# Altium schematic sheet [09] - POWER.SchDoc
size A2; DocumentNumber: 2; SheetNumber: 9; SheetTotal: 10
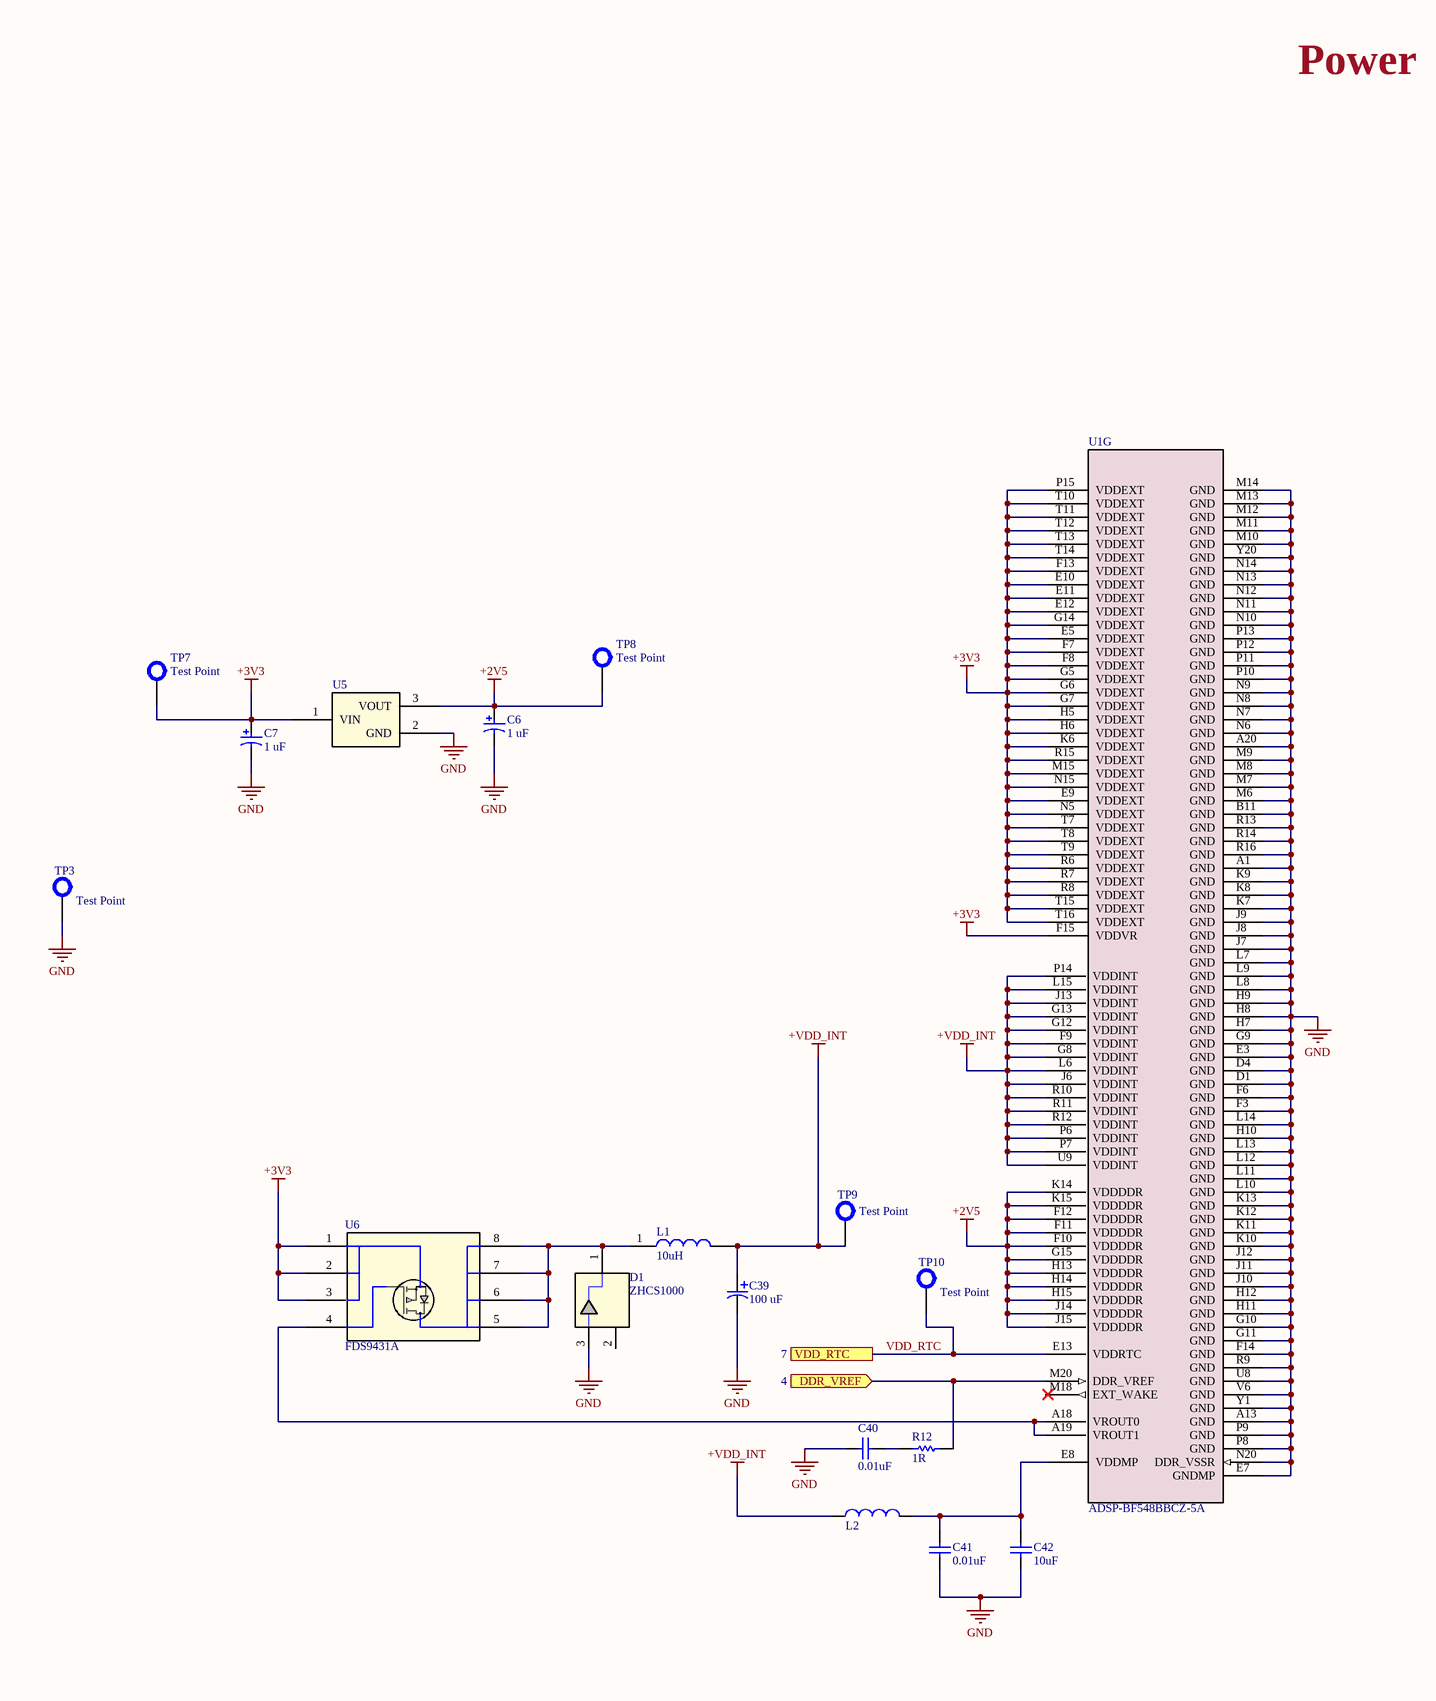
[diagram p0: [09] - POWER.SchDoc, left]
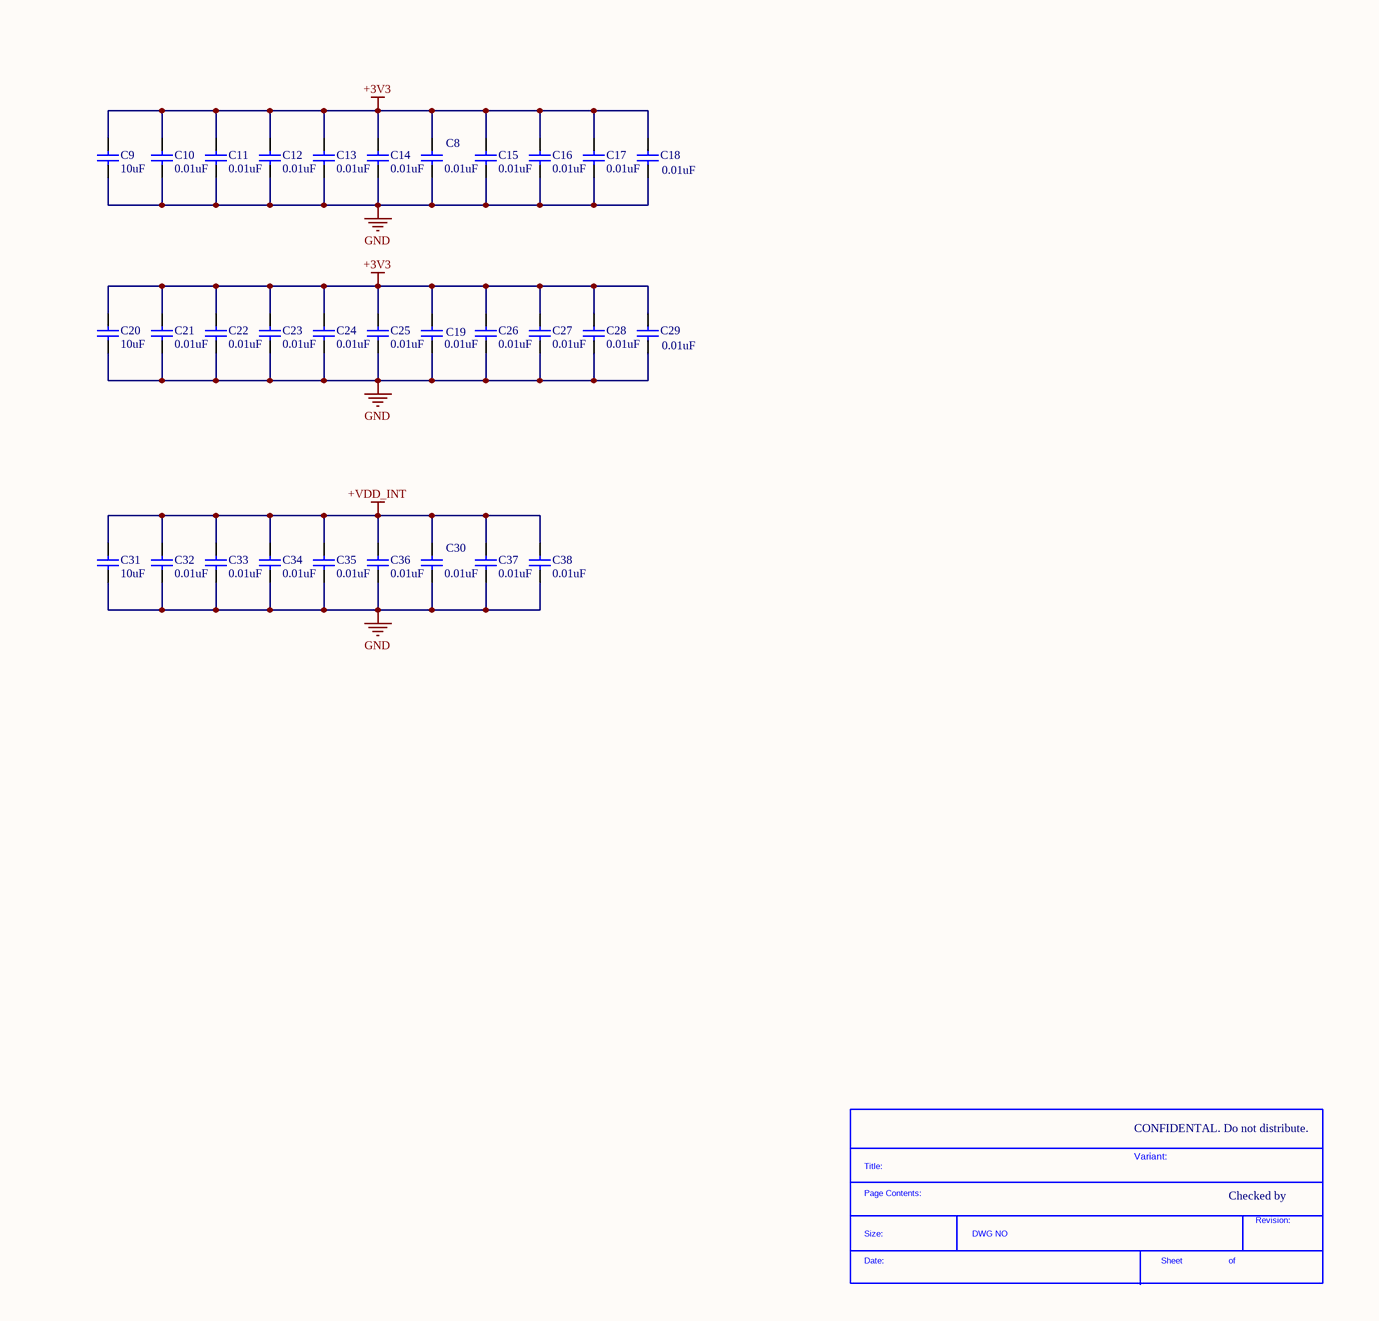
[diagram p1: [09] - POWER.SchDoc, right]

## Parts
*  SDTitleBlock  (value not drawn)  (graphical)
C6  1 uF  [CAP_TANT_B]
C7  1 uF  [CAP_TANT_B]
C8  0.01uF  [CAP0402]
C9  10uF  [CAP0805]
C10  0.01uF  [CAP0402]
C11  0.01uF  [CAP0402]
C12  0.01uF  [CAP0402]
C13  0.01uF  [CAP0402]
C14  0.01uF  [CAP0402]
C15  0.01uF  [CAP0402]
C16  0.01uF  [CAP0402]
C17  0.01uF  [CAP0402]
C18  0.01uF  [CAP0402]
C19  0.01uF  [CAP0402]
C20  10uF  [CAP0805]
C21  0.01uF  [CAP0402]
C22  0.01uF  [CAP0402]
C23  0.01uF  [CAP0402]
C24  0.01uF  [CAP0402]
C25  0.01uF  [CAP0402]
C26  0.01uF  [CAP0402]
C27  0.01uF  [CAP0402]
C28  0.01uF  [CAP0402]
C29  0.01uF  [CAP0402]
C30  0.01uF  [CAP0402]
C31  10uF  [CAP0805]
C32  0.01uF  [CAP0402]
C33  0.01uF  [CAP0402]
C34  0.01uF  [CAP0402]
C35  0.01uF  [CAP0402]
C36  0.01uF  [CAP0402]
C37  0.01uF  [CAP0402]
C38  0.01uF  [CAP0402]
C39  100 uF  [CAP_TANT_C]
C40  0.01uF  [CAP0402]
C41  0.01uF  [CAP0402]
C42  10uF  [CAP0805]
D1  ZHCS1000  [SOT23_3_TOS-L]
L1  10uH  [IND_5818_WE-TPC]
L2  600 Ohms @ 100MHz  [IND-0603]  (value not drawn)
R12  1R  [RES0402]
TP3  Test Point  [TP_70MIL]
TP7  Test Point  [TP_70MIL]
TP8  Test Point  [TP_70MIL]
TP9  Test Point  [TP_70MIL]
TP10  Test Point  [TP_70MIL]
U1  ADSP-BF548BBCZ-5A  [BC_400_1_ADI]  (part G of 7)
U5  TC1262-2.5VDBTR  [SOT-223]  (value not drawn)
U6  FDS9431A  [SOIC8]

## Ports
DDR_VREF (in, see 4), VDD_RTC (see 7)

## Nets
+2V5: C6.1 TP8.0 U1.F10(VDDDDR) U1.F11(VDDDDR) U1.F12(VDDDDR) U1.G15(VDDDDR) U1.H13(VDDDDR) U1.H14(VDDDDR) U1.H15(VDDDDR) U1.J14(VDDDDR) U1.J15(VDDDDR) U1.K14(VDDDDR) U1.K15(VDDDDR) U5.3(VOUT)
+3V3: C7.1 C8.2 C9.2 C10.2 C11.2 C12.2 C13.2 C14.2 C15.2 C16.2 C17.2 C18.2 C19.2 C20.2 C21.2 C22.2 C23.2 C24.2 C25.2 C26.2 C27.2 C28.2 C29.2 TP7.0 U1.E5(VDDEXT) U1.E9(VDDEXT) U1.E10(VDDEXT) U1.E11(VDDEXT) U1.E12(VDDEXT) U1.F7(VDDEXT) U1.F8(VDDEXT) U1.F13(VDDEXT) U1.F15(VDDVR) U1.G5(VDDEXT) U1.G6(VDDEXT) U1.G7(VDDEXT) U1.G14(VDDEXT) U1.H5(VDDEXT) U1.H6(VDDEXT) U1.K6(VDDEXT) U1.M15(VDDEXT) U1.N5(VDDEXT) U1.N15(VDDEXT) U1.P15(VDDEXT) U1.R6(VDDEXT) U1.R7(VDDEXT) U1.R8(VDDEXT) U1.R15(VDDEXT) U1.T7(VDDEXT) U1.T8(VDDEXT) U1.T9(VDDEXT) U1.T10(VDDEXT) U1.T11(VDDEXT) U1.T12(VDDEXT) U1.T13(VDDEXT) U1.T14(VDDEXT) U1.T15(VDDEXT) U1.T16(VDDEXT) U5.1(VIN) U6.1 U6.2 U6.3
+VDD_INT: C30.2 C31.2 C32.2 C33.2 C34.2 C35.2 C36.2 C37.2 C38.2 C39.1 L1.2 L2.1 TP9.0 U1.F9(VDDINT) U1.G8(VDDINT) U1.G12(VDDINT) U1.G13(VDDINT) U1.J6(VDDINT) U1.J13(VDDINT) U1.L6(VDDINT) U1.L15(VDDINT) U1.P6(VDDINT) U1.P7(VDDINT) U1.P14(VDDINT) U1.R10(VDDINT) U1.R11(VDDINT) U1.R12(VDDINT) U1.U9(VDDINT)
GND: C6.2 C7.2 C8.1 C9.1 C10.1 C11.1 C12.1 C13.1 C14.1 C15.1 C16.1 C17.1 C18.1 C19.1 C20.1 C21.1 C22.1 C23.1 C24.1 C25.1 C26.1 C27.1 C28.1 C29.1 C30.1 C31.1 C32.1 C33.1 C34.1 C35.1 C36.1 C37.1 C38.1 C39.2 C40.1 C41.1 C42.1 D1.3(anode) TP3.0 U1.A1(GND) U1.A13(GND) U1.A20(GND) U1.B11(GND) U1.D1(GND) U1.D4(GND) U1.E3(GND) U1.E7(GNDMP) U1.F3(GND) U1.F6(GND) U1.F14(GND) U1.G9(GND) U1.G10(GND) U1.G11(GND) U1.H7(GND) U1.H8(GND) U1.H9(GND) U1.H10(GND) U1.H11(GND) U1.H12(GND) U1.J7(GND) U1.J8(GND) U1.J9(GND) U1.J10(GND) U1.J11(GND) U1.J12(GND) U1.K7(GND) U1.K8(GND) U1.K9(GND) U1.K10(GND) U1.K11(GND) U1.K12(GND) U1.K13(GND) U1.L7(GND) U1.L8(GND) U1.L9(GND) U1.L10(GND) U1.L11(GND) U1.L12(GND) U1.L13(GND) U1.L14(GND) U1.M6(GND) U1.M7(GND) U1.M8(GND) U1.M9(GND) U1.M10(GND) U1.M11(GND) U1.M12(GND) U1.M13(GND) U1.M14(GND) U1.N6(GND) U1.N7(GND) U1.N8(GND) U1.N9(GND) U1.N10(GND) U1.N11(GND) U1.N12(GND) U1.N13(GND) U1.N14(GND) U1.N20(DDR_VSSR) U1.P8(GND) U1.P9(GND) U1.P10(GND) U1.P11(GND) U1.P12(GND) U1.P13(GND) U1.R9(GND) U1.R13(GND) U1.R14(GND) U1.R16(GND) U1.U8(GND) U1.V6(GND) U1.Y1(GND) U1.Y20(GND) U5.2(GND)
DDR_VREF: R12.2 U1.M20(DDR_VREF) ; port DDR_VREF
VDD_RTC: TP10.0 U1.E13(VDDRTC) ; port VDD_RTC
NetC40_2: C40.2 R12.1
NetC41_2: C41.2 C42.2 L2.2 U1.E8(VDDMP)
NetD1_1: D1.1(cathode) L1.1 U6.5 U6.6 U6.7 U6.8
NetU1_A18: U1.A18(VROUT0) U1.A19(VROUT1) U6.4

Not connected (* = marked no-connect by the designer): D1 2(n.c.); U1 M18(EXT_WAKE)

## Notes on the sheet
- Power
- CONFIDENTAL. Do not distribute.
- Variant:
- Checked by
- (in symbol SDTitleBlock) Title:; Page Contents:; Revision:; Size:; DWG NO; Date:; Sheet; of

## Library data of the parts
C6 C7 = T491B105M025AT: Tantalum Capacitor, 1 uF, +/- 10%, 25 V, -55 to 125 degC, 1411 (3528 Metric), RoHS, Tape and Reel; Manufacturer: Kemet; Wire Form: NotRequired; DF: 4%; Product Diameter (mm): NotRequiredmm; Product Depth (mm): 2.8mm; Voltage: 25VDC; DCL: 0.5uA; Capacitance: 1uF; Product Height (mm): 1.9mm; ESR: 5ohm; Product Length (mm): 3.5mm; Polarity: Polar; Case Style: Molded; Package / Case: 3528-21; Failure Rate: NotRequired; Datasheet Version: 10/2016; Seal: NotRequired; Package Reference: T491-B; Insulation: NotRequired; Tolerance (+ or -): 10%; Length W/Weld: NotRequiredmm; Lead Spacing (nom): NotRequiredmm; Packaging: TapeandReel; Operating Temp Range: -55Cto125C; Case Code: B; Mounting Technology: SurfaceMount; Datasheet URL: http://capacitoredge.kemet.com/capedge2/DataSheet/Datasheet-T491B105K025AT.pdf?pn=T491B105K025AT; Construction: SMTChip; Seated Plane Height: NotRequiredmm; Manufacturer URL: http://www.kemet.com/; Mounting Style: SurfaceMount; Package Description: 2-Pin Surface Mount Device, Body 3.5 x 2.8 mm
C8 C10-C19 C21-C30 C32-C38 C40 C41 = CMP-2008-02797-1: AVX - 0402YC103KAT2A - SMD Multilayer Ceramic Capacitor, 0,01 uF, 16 V, 0402 [1005 Metric], ± 10%, X7R, AVX 0402 MLCC; Manufacturer: AVX Interconnect / Elco; Capacitance: 10nF; Voltage Rating (DC): 16V; Insulation Resistance: 100GR; Part Number: 0402YC103KAT2A; Supplier 1: Digi-Key; Manufacturer Part Number: 0402YC103KAT2A; RoHS: Yes; Category: Ceramic Capacitors; Stock 1: 1668180; Pricing 1: 1=0.10000, 10=0.02100, 50=0.01120, 100=0.00920, 500=0.00654, 1000=0.00514, 2500=0.00468, 5000=0.00430 (USD); Mount: Surface Mount; Case/Package: 0402; Case Code (Imperial): 0402; Case Code (Metric): 1005; Contact Plating: Tin,Matte; Min Operating Temperature: -55°C; Max Operating Temperature: 125°C; Tolerance: 10%; Dielectric: X7R; Packaging: Tape and Reel; Voltage: 16V; Voltage Rating: 16V; Package Quantity: 1; Termination: SMD/SMT; Length: 1mm; Width: 0.5mm; Height: 0.5mm; Depth: 0.5mm; Thickness: 0.022inch; Radiation Hardening: No; REACH SVHC: No SVHC; Lead Free: Lead Free; ComponentLink1URL: https://datasheet.ciiva.com/11788/0900766b80dc2409-11788541.pdf?src-supplier=RSComponents; ComponentLink1Description: https://datasheet.ciiva.com/11788/0900766b80dc2409-11788541.pdf?src-supplier=RSComponents
C9 C20 C31 C42 = 08056D106KAT2A: Cap Ceramic 10uF 6.3V X5R 10% SMD 0805 85C Embossed T/R; Manufacturer: AVX Interconnect / Elco; Insulation Resistance: 500MR; Part Number: 08056D106KAT2A; Supplier 1: Digi-Key; Category: Ceramic Capacitors; Manufacturer Part Number: 08056D106KAT2A; RoHS: Yes; Stock 1: 132568; Pricing 1: 1=0.24000, 10=0.16300, 50=0.09800, 100=0.08280, 500=0.05662, 1000=0.05009 (USD); Mount: Surface Mount,PCB; Case/Package: 0805; Number of Pins: 2; Case Code (Imperial): 0805; Case Code (Metric): 2012; Dielectric Material: Ceramic; Min Operating Temperature: -55°C; Max Operating Temperature: 85°C; Capacitance: 10uF; Tolerance: 10%; Dielectric: X5R; Voltage Rating (DC): 6.3V; Packaging: Tape and Reel; Voltage: 6.3V; Package Quantity: 1; Voltage Rating: 6.3V; Termination: SMD/SMT; Length: 2.01mm; Width: 1.25mm; Height: 1.4mm; Depth: 1.25mm; Thickness: 0.055inch; Radiation Hardening: No; REACH SVHC: No SVHC; Lead Free: Lead Free; ComponentLink1URL: https://datasheet.ciiva.com/11788/0900766b80def1a5-11788549.pdf?src-supplier=RSComponents; ComponentLink1Description: https://datasheet.ciiva.com/11788/0900766b80def1a5-11788549.pdf?src-supplier=RSComponents
C39 = T495C107K006ATE075: CAP TANT 100UF 6.3V 10% 2312; Vendor: Kemet; SourceLibrary: Kemet_2020-03-25_3; Built_By: EMA_Frank; Source_Library: Kemet_2020-03-25_3.xlr; Type: DEV; Resistance: 0.075R; Leakage Current: 6.3uA; Polarity: Polar; ESR (Equivalent Series Resistance): 75mR; Ripple Current: 1.09A; Life (Hours): 2000Hour; Dissipation Factor: 8%; Manufacturer_Part_Number: T495C107K006ATE075; Copyright: Copyright (C) 2018 Accelerated Designs. All rights reserved; RefDes: RefDes; Supplier 1: Digi-Key; Manufacturer: KEMET; Manufacturer Part Number: T495C107K006ATE075; RoHS: Yes; Category: Tantalum Capacitors; Stock 1: 5300; Pricing 1: 1=1.19000, 10=0.93800, 50=0.81260, 100=0.70310 (USD); Mount: Surface Mount; Case/Package: Molded; Case Code (Metric): 6032; Case Code (Imperial): 2312; Min Operating Temperature: -55°C; Max Operating Temperature: 125°C; Termination: SMD/SMT; Packaging: Tape and Reel; Capacitance: 100uF; Tolerance: 10%; Voltage Rating: 6.3V; Package Quantity: 1; Voltage Rating (DC): 6.3V; Features: General Purpose; Length: 6mm; Width: 0.126inch; Height: 2.8mm; Height - Seated (Max): 0.11inch; Depth: 3.2mm; Radiation Hardening: No; REACH SVHC: No SVHC; ComponentLink1URL: https://datasheet.ciiva.com/23810/1744558-23810593.pdf?src-supplier=Newark; ComponentLink1Description: https://datasheet.ciiva.com/23810/1744558-23810593.pdf?src-supplier=Newark; ComponentLink2URL: https://datasheet.ciiva.com/22691/1761160-22691450.pdf?src-supplier=Element14; ComponentLink2Description: https://datasheet.ciiva.com/22691/1761160-22691450.pdf?src-supplier=Element14; ComponentLink3URL: https://datasheet.ciiva.com/22691/1744558-22691451.pdf?src-supplier=Element14; ComponentLink3Description: https://datasheet.ciiva.com/22691/1744558-22691451.pdf?src-supplier=Element14
D1 = ZHCS1000: DIODES INC. - ZHCS1000 - Schottky Rectifier, 40 V, 1 A, Single, SOT-23, 3 Pins, 425 mV; Max Repetitive Reverse Voltage (Vrrm): 40V; Forward Current: 1A; Reverse Recovery Time: 12ns; Forward Voltage: 425mV; Max Forward Surge Current (Ifsm): 12A; Max Power Dissipation: 500mW; Supplier 1: Newark; Manufacturer: Diodes; Manufacturer Part Number: ZHCS1000; RoHS: Yes; Category: Rectifier Diodes; Case/Package: SOT-23; Number of Pins: 3; Max Operating Temperature: 125°C; Element Configuration: Single; Packaging: Cut Tape; Termination: SMD/SMT; Width: 3.05mm; REACH SVHC: No SVHC; ComponentLink1URL: https://datasheet.ciiva.com/6932/1643161-6932065.pdf?src-supplier=Newark; ComponentLink1Description: https://datasheet.ciiva.com/6932/1643161-6932065.pdf?src-supplier=Newark; ComponentLink2URL: https://datasheet.ciiva.com/7964/312100-7964339.pdf?src-supplier=Element14; ComponentLink2Description: https://datasheet.ciiva.com/7964/312100-7964339.pdf?src-supplier=Element14
L1 = 744053100: 10µH Shielded Wirewound Inductor 1.5A 70mOhm Max 2323 (5858 Metric); Manufacturer: Würth Elektronik; Current Rating: 1,5A; Digi-Key Part Number: 732-1043-2-ND; Manufacturer Product Number: 744053100; Package / Case: 2323 (5858 Metric); Inductance: 10µH
L2 = 732-2389-2-ND: Ferritperle, 0603 [Metrisch 1608], 600 ohm, 500 mA, WE-CBF HF Series, 0.35 ohm, ± 25%; Manufacturer: Wurth Electronics; Manufacturer Part Number: 742863160; Impedance: 600 Ohm; Core Material: Ferrite; Resistance: 350mR; Max Current Rating: 500mA; Number of Lines: 1; PackageDescription: Chip Inductor, 2-Leads, Body 1.6 x 0.8 mm; PackageReference: SMD-0603; DatasheetVersion: ver 2, Aug-2009; ComponentLink1URL: http://www.we-online.com; ComponentLink2URL: http://www.we-online.de/katalog/media/pdf/742863160.pdf; ComponentLink2Description: Datasheet; ComponentLink1Description: Manufacturer Link; PackageVersion: 2009; Supplier 1: Digi-Key; RoHS: Yes; Category: Ferrite Beads and Chips; Stock 1: 26940; Pricing 1: 1=0.22000, 50=0.21200, 100=0.20200, 500=0.18100, 1000=0.17100, 2000=0.16100 (USD); Mount: Surface Mount; Case/Package: SMD/SMT; Number of Pins: 2; Case Code (Metric): 1608; Case Code (Imperial): 0603; Min Operating Temperature: -55°C; Max Operating Temperature: 125°C; Package Quantity: 1; Packaging: Tape and Reel; Tolerance: 25%; Max DC Current: 500mA; DC Resistance (DCR): 350mR; Termination: SMD/SMT; Test Frequency: 100MHz; Length: 1.6mm; Width: 0.8mm; Height: 0.8mm; Depth: 0.8mm; REACH SVHC: Unknown; Lead Free: Lead Free; ComponentLink3URL: https://datasheet.ciiva.com/4939/742863160-51474-4939408.pdf?src-supplier=Mouser; ComponentLink3Description: https://datasheet.ciiva.com/4939/742863160-51474-4939408.pdf?src-supplier=Mouser; ComponentLink4URL: https://datasheet.ciiva.com/23763/742863160-23763056.pdf?src-supplier=Newark; ComponentLink4Description: https://datasheet.ciiva.com/23763/742863160-23763056.pdf?src-supplier=Newark; ComponentLink5URL: https://datasheet.ciiva.com/30490/0900766b812a6726-30490032.pdf?src-supplier=RSComponents; ComponentLink5Description: https://datasheet.ciiva.com/30490/0900766b812a6726-30490032.pdf?src-supplier=RSComponents; ComponentLink6URL: https://datasheet.ciiva.com/6212/742863160-6212664.pdf?src-supplier=Digi-Key; ComponentLink6Description: https://datasheet.ciiva.com/6212/742863160-6212664.pdf?src-supplier=Digi-Key; ComponentLink7URL: https://datasheet.ciiva.com/1466/1696149-1466636.pdf?src-supplier=Element14; ComponentLink7Description: https://datasheet.ciiva.com/1466/1696149-1466636.pdf?src-supplier=Element14; ComponentLink8URL: https://datasheet.ciiva.com/6212/742863160-6212666.pdf?src-supplier=Digi-Key; ComponentLink8Description: https://datasheet.ciiva.com/6212/742863160-6212666.pdf?src-supplier=Digi-Key; ComponentLink9URL: https://datasheet.ciiva.com/6212/742863160-6212667.pdf?src-supplier=Digi-Key; ComponentLink9Description: https://datasheet.ciiva.com/6212/742863160-6212667.pdf?src-supplier=Digi-Key; ComponentLink10URL: https://datasheet.ciiva.com/22711/1696149-22711452.pdf?src-supplier=Element14; ComponentLink10Description: https://datasheet.ciiva.com/22711/1696149-22711452.pdf?src-supplier=Element14
R12 = 541-1.00LCT-ND: RES SMD 1 OHM 1% 1/16W 0402; Manufacturer: Vishay; Manufacturer Part Number: CRCW04021R00FNED; Power Rating: 63mW; Voltage Rating: 50V; Temperature Coefficient: 200ppm/°C; Supplier 1: Digi-Key; RoHS: Yes; Category: Chip SMD Resistors; Stock 1: 7772; Pricing 1: 1=0.10000, 10=0.05000, 100=0.02040, 1000=0.00914, 2500=0.00794, 5000=0.00656 (USD); Mount: Surface Mount; Case/Package: 0402; Number of Pins: 2; Weight: 2.3E-05oz; Case Code (Metric): 1005; Case Code (Imperial): 0402; Contact Plating: Tin; Min Operating Temperature: -55°C; Max Operating Temperature: 155°C; Resistance: 1R; Tolerance: 1%; Packaging: Tape and Reel; Package Quantity: 10000; Resistor Type: Thick Film; Number of Terminations: 2; Termination: SMD/SMT; Max Power Dissipation: 63mW; Voltage Rating (DC): 50V; Features: Automotive AEC-Q200; Length: 1mm; Width: 0.02inch; Height: 0.016inch; Depth: 0.5mm; Radiation Hardening: No; REACH SVHC: Unknown; Military Standard: Not; Lead Free: Lead Free; ComponentLink1URL: https://datasheet.ciiva.com/2560/dcrcwe3-2560101.pdf?src-supplier=Digi-Key; ComponentLink1Description: https://datasheet.ciiva.com/2560/dcrcwe3-2560101.pdf?src-supplier=Digi-Key; ComponentLink2URL: https://datasheet.ciiva.com/6027/1697337-6027861.pdf?src-supplier=Farnell; ComponentLink2Description: https://datasheet.ciiva.com/6027/1697337-6027861.pdf?src-supplier=Farnell; ComponentLink3URL: https://datasheet.ciiva.com/2560/dcrcwe3-2560102.pdf?src-supplier=Digi-Key; ComponentLink3Description: https://datasheet.ciiva.com/2560/dcrcwe3-2560102.pdf?src-supplier=Digi-Key; ComponentLink4URL: https://datasheet.ciiva.com/2560/dcrcwe3-2560103.pdf?src-supplier=Digi-Key; ComponentLink4Description: https://datasheet.ciiva.com/2560/dcrcwe3-2560103.pdf?src-supplier=Digi-Key; ComponentLink5URL: https://datasheet.ciiva.com/3256/dcrcwe3-3256199.pdf?src-supplier=Avnet; ComponentLink5Description: https://datasheet.ciiva.com/3256/dcrcwe3-3256199.pdf?src-supplier=Avnet; ComponentLink6URL: https://datasheet.ciiva.com/3256/dcrcwe3-3256200.pdf?src-supplier=Avnet; ComponentLink6Description: https://datasheet.ciiva.com/3256/dcrcwe3-3256200.pdf?src-supplier=Avnet; ComponentLink7URL: https://datasheet.ciiva.com/5552/dcrcwe3-109170-5552232.pdf?src-supplier=Mouser; ComponentLink7Description: https://datasheet.ciiva.com/5552/dcrcwe3-109170-5552232.pdf?src-supplier=Mouser; ComponentLink8URL: https://datasheet.ciiva.com/16436/dcrcwe3-16436173.pdf?src-supplier=Future+Electronics; ComponentLink8Description: https://datasheet.ciiva.com/16436/dcrcwe3-16436173.pdf?src-supplier=Future+Electronics; ComponentLink9URL: https://datasheet.ciiva.com/7841/125364-7841807.pdf?src-supplier=Element14; ComponentLink9Description: https://datasheet.ciiva.com/7841/125364-7841807.pdf?src-supplier=Element14
TP3 TP7-TP10 = TP
U1 = ADSP-BF548BBCZ-5A: IC DSP 16BIT 533MHZ 400CSBGA; Manufacturer: Analog Devices Inc.; Manufacturer_Part_Number: ADSP-BF548BBCZ-5A; Supplier: Analog Devices Inc.; Manufacturer Product Number: ADSP-BF548BBCZ-5A; TypeDigi-Key Part Number: ADSP-BF548BBCZ-5A-ND
U5 = TC1262-2.5VDBTR: Linear Voltage Regulator IC  1 Output  500mA SOT-223-3; Manufacturer: Microchip; Output Voltage: 2.5V; Dropout Voltage: 350mV; Max Input Voltage: 6V; Min Input Voltage: 2.7V; Number of Outputs: 1; Input Bias Current: 80uA; Polarity: Positive; Accuracy: 0.5%; Output Type: Fixed; Supplier 1: Digi-Key; Manufacturer Part Number: TC1262-2.5VDBTR; RoHS: Yes; Category: Voltage Regulators - Linear; Stock 1: 2386; Pricing 1: 1=0.51000, 25=0.43000, 100=0.39000 (USD); Mount: Surface Mount; Case/Package: SOT-223-3; Number of Pins: 3; Contact Plating: Tin,Matte; Min Operating Temperature: -40°C; Max Operating Temperature: 125°C; Package Quantity: 4000; Packaging: Tape and Reel; Output Current: 500mA; Max Output Current: 500mA; Number of Regulators: 1; Quiescent Current: 80uA; Radiation Hardening: No; ComponentLink1URL: https://datasheet.ciiva.com/2056/filehandler-aspxddocname-en026002-2056324.pdf?src-supplier=Digi-Key; ComponentLink1Description: https://datasheet.ciiva.com/2056/filehandler-aspxddocname-en026002-2056324.pdf?src-supplier=Digi-Key; ComponentLink2URL: https://datasheet.ciiva.com/2056/filehandler-aspxddocname-en026002-2056325.pdf?src-supplier=Digi-Key; ComponentLink2Description: https://datasheet.ciiva.com/2056/filehandler-aspxddocname-en026002-2056325.pdf?src-supplier=Digi-Key; ComponentLink3URL: https://datasheet.ciiva.com/2056/filehandler-aspxddocname-en026002-2056326.pdf?src-supplier=Digi-Key; ComponentLink3Description: https://datasheet.ciiva.com/2056/filehandler-aspxddocname-en026002-2056326.pdf?src-supplier=Digi-Key; ComponentLink4URL: https://datasheet.ciiva.com/8239/21373b-8239238.pdf?src-supplier=Avnet; ComponentLink4Description: https://datasheet.ciiva.com/8239/21373b-8239238.pdf?src-supplier=Avnet
U6 = FDS9926A: Trans MOSFET P-CH 20V 3.5A 8-Pin SOIC N T/R; Manufacturer: ON Semiconductor / Fairchild; Input Capacitance: 405pF; Max Power Dissipation: 2.5W; Rds On Max: 130mR; Rise Time: 20ns; Drain to Source Breakdown Voltage: -20V; Gate to Source Voltage (Vgs): 8V; Fall Time: 21ns; Turn-Off Delay Time: 31ns; Turn-On Delay Time: 6.5ns; Element Configuration: Single; Number of Elements: 1; Current Rating: -3.5A; Nominal Vgs: -600mV; Supplier 1: Digi-Key; Manufacturer Part Number: FDS9431A; RoHS: Yes; Category: MOSFETs; Stock 1: 2709; Pricing 1: 1=0.68000, 10=0.59800, 25=0.56160, 100=0.40750, 500=0.34046, 1000=0.28976 (USD); Mount: Surface Mount; Case/Package: SOIC; Number of Pins: 8; Weight: 0.2304g; Contact Plating: Tin,Matte; Min Operating Temperature: -55°C; Max Operating Temperature: 175°C; Packaging: Tape and Reel; Package Quantity: 2500; Drain to Source Voltage (Vdss): 20V; Continuous Drain Current (ID): 3.5A; Drain to Source Resistance: 130mR; Power Dissipation: 2.5W; Voltage Rating (DC): -20V; On-State Resistance: 130mR; Threshold Voltage: -600mV; Dual Supply Voltage: -20V; Termination: SMD/SMT; Length: 5mm; Width: 4mm; Height: 1.5mm; Radiation Hardening: No; Lead Free: Lead Free; REACH SVHC: No SVHC; ComponentLink1URL: https://datasheet.ciiva.com/1256/fds9431a-1256128.pdf?src-supplier=Newark; ComponentLink1Description: https://datasheet.ciiva.com/1256/fds9431a-1256128.pdf?src-supplier=Newark; ComponentLink2URL: https://datasheet.ciiva.com/15137/getdatasheetpartid-70130-15137336.pdf?src-supplier=Verical; ComponentLink2Description: https://datasheet.ciiva.com/15137/getdatasheetpartid-70130-15137336.pdf?src-supplier=Verical; ComponentLink3URL: https://datasheet.ciiva.com/4441/fds9431a-111226-4441596.pdf?src-supplier=Mouser; ComponentLink3Description: https://datasheet.ciiva.com/4441/fds9431a-111226-4441596.pdf?src-supplier=Mouser; ComponentLink4URL: https://datasheet.ciiva.com/932/fds9431a-932295.pdf?src-supplier=Digi-Key; ComponentLink4Description: https://datasheet.ciiva.com/932/fds9431a-932295.pdf?src-supplier=Digi-Key; ComponentLink5URL: https://datasheet.ciiva.com/932/fds9431a-932296.pdf?src-supplier=Digi-Key; ComponentLink5Description: https://datasheet.ciiva.com/932/fds9431a-932296.pdf?src-supplier=Digi-Key; ComponentLink6URL: https://datasheet.ciiva.com/8114/fds9431a-8114667.pdf?src-supplier=Avnet; ComponentLink6Description: https://datasheet.ciiva.com/8114/fds9431a-8114667.pdf?src-supplier=Avnet; ComponentLink7URL: https://datasheet.ciiva.com/932/fds9431a-932294.pdf?src-supplier=Digi-Key; ComponentLink7Description: https://datasheet.ciiva.com/932/fds9431a-932294.pdf?src-supplier=Digi-Key; ComponentLink8URL: https://datasheet.ciiva.com/26141/fds9431a-26141927.pdf?src-supplier=Avnet+Europe; ComponentLink8Description: https://datasheet.ciiva.com/26141/fds9431a-26141927.pdf?src-supplier=Avnet+Europe; ComponentLink9URL: https://datasheet.ciiva.com/8114/fds9431a-8114671.pdf?src-supplier=Avnet; ComponentLink9Description: https://datasheet.ciiva.com/8114/fds9431a-8114671.pdf?src-supplier=Avnet